# Altium project ECE453.PrjPcb
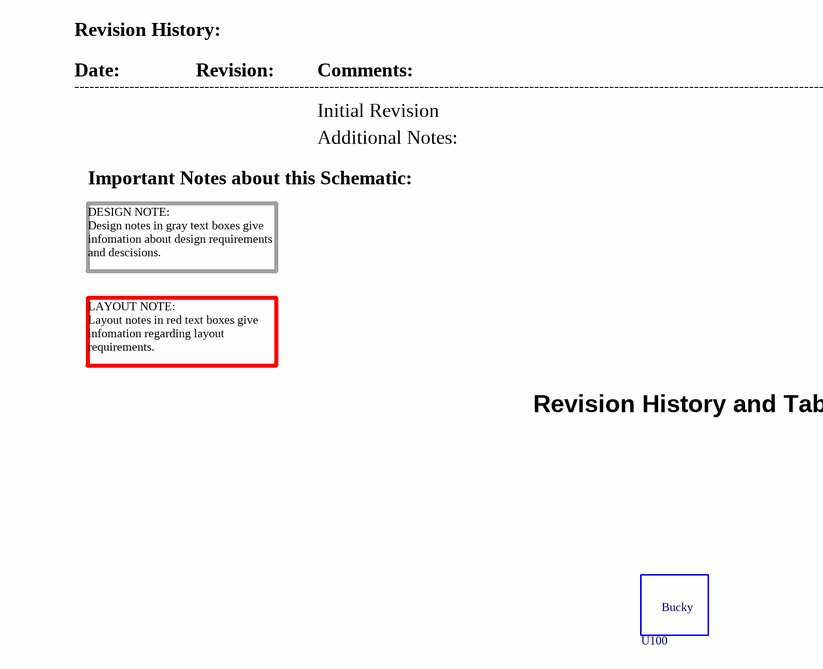
[diagram p0: 01-Revision_History_and_Contents.SchDoc]
4 sheets, 36 parts. Net scope: global (net labels, ports and power ports of the same name join across sheets).
Board file: ECE453.PcbDoc
Sheets:
  01-Revision_History_and_Contents.SchDoc
  02_Connectors.SchDoc
  03-ICs.SchDoc
  04-ICs.SchDoc

## Sheet 01-Revision_History_and_Contents.SchDoc: Revision & History
size A; Revision: A; SheetNumber: 1; SheetTotal: 3; ECE315_Project_Name: ECE453 F24

### Parts
U100  Bucky  [WalkingBucky]  (value not drawn)  (no BOM)

### Notes on the sheet
- Revision History:
- Date:
- ----------------------------------------------------------------------------------------------------------------------------------------------------------------------
- Revision:
- Comments:
- Initial Revision
- Important Notes about this Schematic:
- Additional Notes:
- DESIGN NOTE:
  Design notes in gray text boxes give infomation about design requirements and descisions.
- LAYOUT NOTE:
  Layout notes in red text boxes give infomation regarding layout requirements.
- Revision History and Table of Contents
- Title:
- Size:
- A
- Project
- Rev:
- Sheet:
- of
- College of Engineering
- 1415 Engineering Drive
- Madison, WI 53706

### Library data of the parts
U100 = Bucky: Bucky Badger Image; Manufacturer Part Number: UW Bucky

## Sheet 02_Connectors.SchDoc: Off Board Connectors
size A; Revision: A; SheetNumber: 2; SheetTotal: 3; ECE315_Project_Name: ECE453 F24
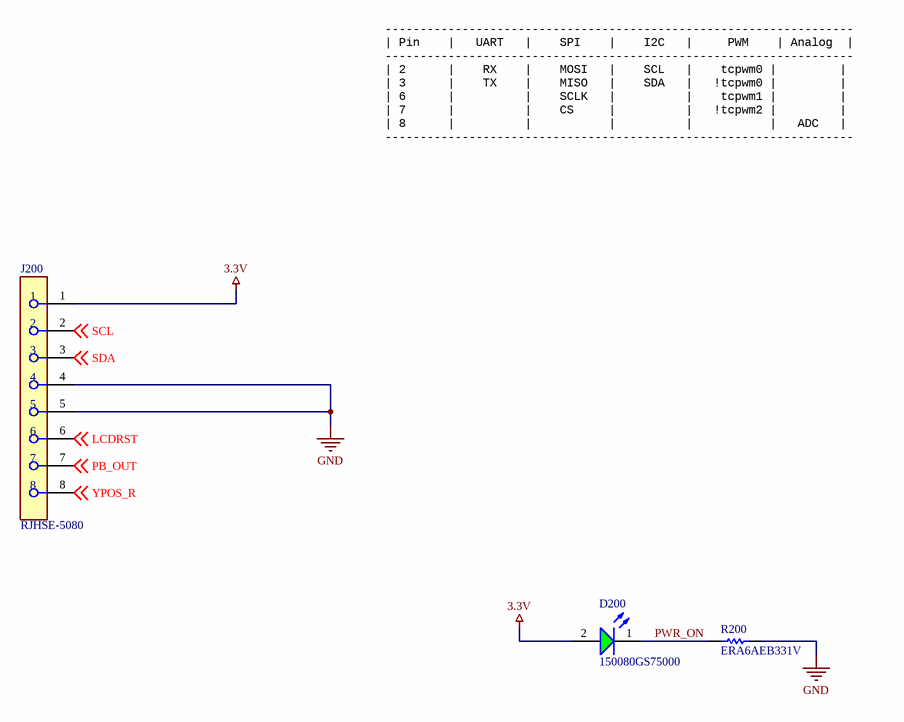
[diagram p1: 02_Connectors.SchDoc]

### Parts
D200  150080GS75000  [WL-SMCW_0805_150080xx75000]
J200  RJHSE-5080  [FP-RJHSE-5080-MFG]
R200  ERA6AEB331V  [RESC2013X60X40LL20T25]

### Nets
3.3V: D200.2(A) J200.1
GND: J200.4 J200.5 R200.2
LCDRST: J200.6 ; off-sheet LCDRST
PB_OUT: J200.7 ; off-sheet PB_OUT
PWR_ON: D200.1(K) R200.1
SCL: J200.2 ; off-sheet SCL
SDA: J200.3 ; off-sheet SDA
YPOS_R: J200.8 ; off-sheet YPOS_R

### Notes on the sheet
- -------------------------------------------------------------------
  | Pin    |   UART   |    SPI    |    I2C   |     PWM    | Analog  |
  -------------------------------------------------------------------
  | 2      |    RX    |    MOSI   |    SCL   |    tcpwm0 |         |
  | 3      |    TX    |    MISO   |    SDA   |   !tcpwm0 |         |
  | 6      |          |    SCLK   |          |    tcpwm1 |         |
  | 7      |          |    CS     |          |   !tcpwm2 |         |
  | 8      |          |           |          |           |   ADC   |
  -------------------------------------------------------------------
- Title:
- Size:
- A
- Project
- Rev:
- Sheet:
- of
- College of Engineering
- 1415 Engineering Drive
- Madison, WI 53706

### Library data of the parts
D200 = CMP-1426-00007-3: WURTH ELEKTRONIK - 150080GS75000 - LED, Green, SMD, 0805, 30 mA, 3.2 V, 520 nm; Forward Voltage: 3.2V; Viewing Angle: 140°; Power Dissipation: 105mW; Peak Wavelength: 515nm; Max Reverse Voltage (DC): 5V; Luminous Intensity: 450mcd; Wavelength: 525nm; Max Junction Temperature (Tj): 95°C; Forward Current: 100mA; Test Current: 20mA; Lens Style: Clear, Rectangular; Length: 2mm; Case/Package: 0805; Case Code (Metric): 2012; Color: Green; Height: 700µm; Width: 1.25mm; Packaging: Tape and Reel; Mount: Surface Mount; REACH SVHC: Unknown; RoHS: Compliant; Min Operating Temperature: -40°C; Reverse Voltage: 5V; Max Operating Temperature: 85°C; Dominant Wavelength: 525nm; Case Code (Imperial): 0805
J200 = CMP-02366-000003-1: CONN MOD JACK 8P8C R/A UNSHLD; Manufacturer: Amphenol; Current Rating: 1.5A; Voltage Rating: 125V; Pitch: 1.02mm; Conn Orientation: Right Angle; Number Of Contacts: 8; Is Female: yes; Conn Gender: Female; Contact Resistance: 20mR; Number of Ports: 1; Connector Type: RJ45; Lead Free: Yes; Device Class L3: unset; Footprint Url: https://cdn.amphenol-icc.com/media/wysiwyg/files/drawing/rjhse5080.pdf?__cf_chl_jschl_tk__=e349db0bbbb6188a39347cd5e541b92fa02c9719-1587748343-0-AW7tChdeHzRPLX9gSWj7WrKaXQoY9BsmT9Ek0h-T62M9y3Rs9iypFcOtkzb-6sGYQEjFE-jcoNciDETCOZrh1rYyOesac5SvYLoLwHIsHvF4AKBlx-MXmfZUVk9OTTJLqyQq2qMm0PFRLJpNcK0nrKResqOniRSYixG2sPTmOPraH-ULJFBDL602CHqcI9KKBgTq90Jh1OL2Td4moJ99rFsJRJ1Tk_uoxGe8ublcP_ARu-uLpWcQrBcwOcHDTAwL29DAwVaqcH7ta8Ks7WMlHmVl_pILeEDwT0bE9vu5Pa5S3PtNRF1leuFkgi_FMbUxTDulc5xzbXSfng8srUIV1lWXny5nx1fZJEUa_w97yKjffzBMxiWLWVN-V7-uqAaPbyv_m-wRyw5O25OZNyJOeGU; ComponentLink2URL: https://cdn.amphenol-icc.com/media/wysiwyg/files/documentation/datasheet/inputoutput/io-modjack-rjhse.pdf; Device Class L1: Connectors; Package: CONN_MOD_JACK; Mouser Description: Modular Connectors / Ethernet Connectors R/A RJ45 NONSHIELDED 8 CONT NO LEDS; Manufacturer Part Number: RJHSE-5080; Octopart: https://octopart.com/rjhse-5080-amphenol-45060; Category: Conn; Height: 0.535inch; Temperature: -55°C to +85°C; Digikey Description: CONN MOD JACK 8P8C R/A UNSHLD; Device Class L2: Modular / Ethernet Connectors; Contact Material: Gold,Nickel; ComponentLink2Description: Datasheet; Temperature Range Low: -55°C; RoHS: TRUE; Automotive: No; Temperature Range High: +85°C; Supplier: Digikey; Supplier Part Number: RJHSE-5080-ND; Stock: 72112; Pricing: 1=1.03, 10=0.867, 25=0.832, 50=0.8142, 100=0.7788, 250=0.708, 500=0.6372, 1000=0.56641, 2500=0.51331 (USD); Mounting Technology: Through Hole,Panel; Contact Plating: Gold; Max Current Rating: 1.5A; Number of Positions Loaded: 8; Max Voltage Rating (AC): 125V; Orientation: Right Angle; Packaging: Rail/Tube; Gender: Female; Termination: Solder; Number of Positions: 8; Voltage Rating (DC): 125V; Length: 15.75mm; Depth: 14.99mm; Radiation Hardening: No; RoHS Compliant: Yes; Reach SVHC Compliant: Unknown; ComponentLink1URL: https://datasheet.ciiva.com/7629/1682821-7629402.pdf?src-supplier=Element14; ComponentLink1Description: https://datasheet.ciiva.com/7629/1682821-7629402.pdf?src-supplier=Element14; ComponentLink3URL: https://datasheet.ciiva.com/1432/1693748-1432448.pdf?src-supplier=Element14; ComponentLink3Description: https://datasheet.ciiva.com/1432/1693748-1432448.pdf?src-supplier=Element14
R200 = CMP-2001-00628-1: Manufacturer: Panasonic; Part Number: ERA6AEB331V

## Sheet 03-ICs.SchDoc: ICs
size A; Revision: A; SheetNumber: 3; SheetTotal: 3; ECE315_Project_Name: ECE453 F24
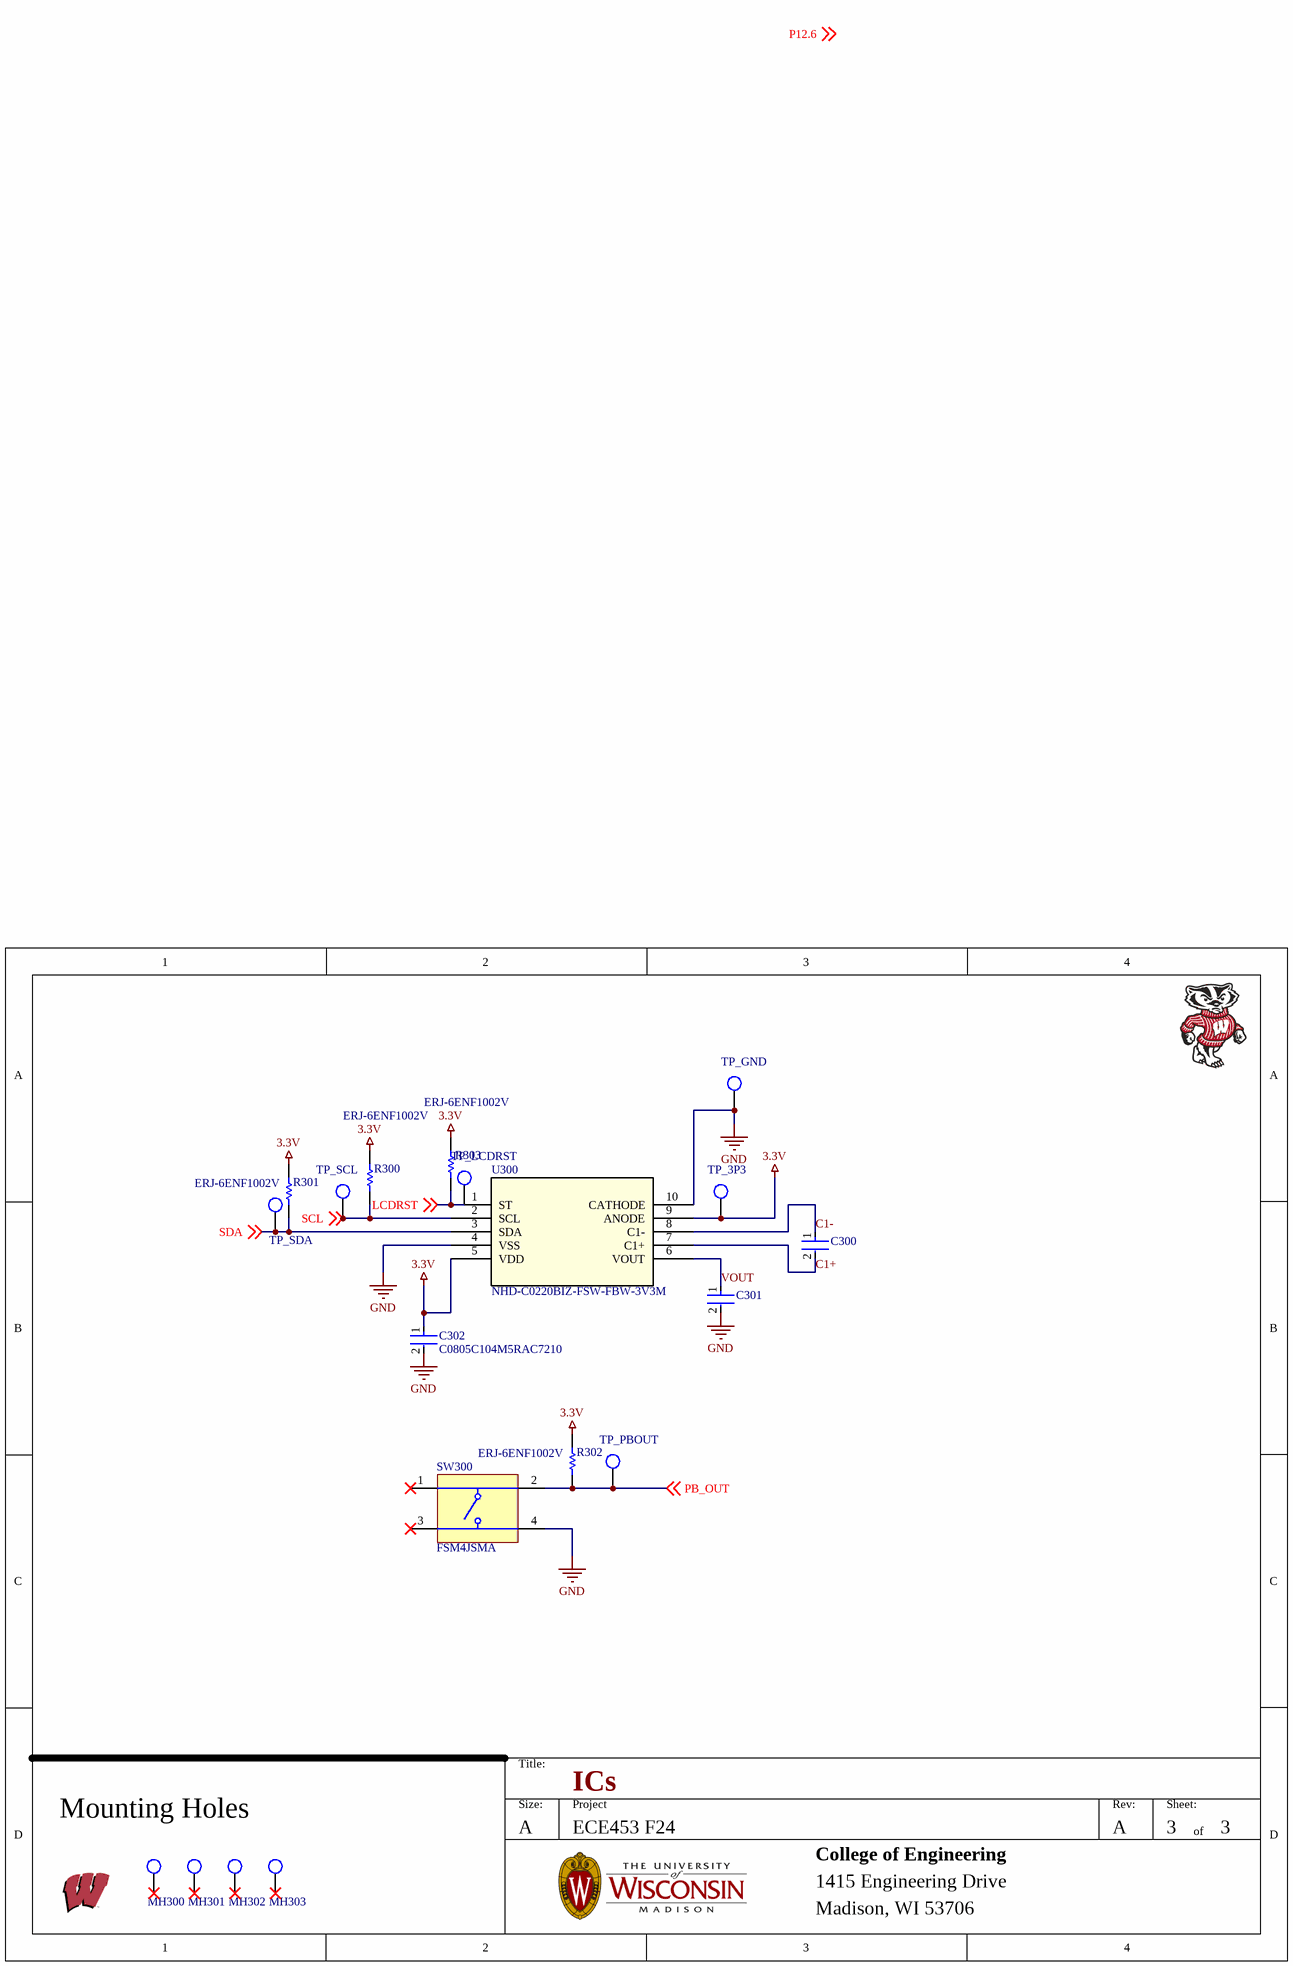
[diagram p2: 03-ICs.SchDoc]

### Parts
C300  C0805C104M5RAC7210  [FP-C0805C-DN-MFG]  (value not drawn)
C301  C0805C104M5RAC7210  [FP-C0805C-DN-MFG]  (value not drawn)
C302  C0805C104M5RAC7210  [FP-C0805C-DN-MFG]
MH300  MHOLE_2_95MM  [MHOLE_2_95MM]  (value not drawn)
MH301  MHOLE_2_95MM  [MHOLE_2_95MM]  (value not drawn)
MH302  MHOLE_2_95MM  [MHOLE_2_95MM]  (value not drawn)
MH303  MHOLE_2_95MM  [MHOLE_2_95MM]  (value not drawn)
R300  ERJ-6ENF1002V  [RESC2013X70X40ML20T20]
R301  ERJ-6ENF1002V  [RESC2013X70X40ML20T20]
R302  ERJ-6ENF1002V  [RESC2013X70X40ML20T20]
R303  ERJ-6ENF1002V  [RESC2013X70X40ML20T20]
SW300  FSM4JSMA  [TECO-FSM4JSMA_V]
TP_3P3  TP_5019  [FP-5019-MFG]  (value not drawn)
TP_GND  TP_5019  [FP-5019-MFG]  (value not drawn)
TP_LCDRST  TP_5019  [FP-5019-MFG]  (value not drawn)
TP_PBOUT  TP_5019  [FP-5019-MFG]  (value not drawn)
TP_SCL  TP_5019  [FP-5019-MFG]  (value not drawn)
TP_SDA  TP_5019  [FP-5019-MFG]  (value not drawn)
U300  NHD-C0220BIZ-FSW-FBW-3V3M  [NHD-C0220BIZ-FSW-FBW-3V3M_NDI]

### Nets
3.3V: C302.1 R300.2 R301.2 R302.2 R303.2 TP_3P3.1 U300.5(VDD) U300.9(ANODE)
GND: C301.2 C302.2 SW300.4 TP_GND.1 U300.4(VSS) U300.10(CATHODE)
C1+: C300.2 U300.7(C1+)
C1-: C300.1 U300.8(C1-)
LCDRST: R303.1 TP_LCDRST.1 U300.1(ST) ; off-sheet LCDRST
PB_OUT: R302.1 SW300.2 TP_PBOUT.1 ; off-sheet PB_OUT
SCL: R300.1 TP_SCL.1 U300.2(SCL) ; off-sheet SCL
SDA: R301.1 TP_SDA.1 U300.3(SDA) ; off-sheet SDA
VOUT: C301.1 U300.6(VOUT)

Not connected (* = marked no-connect by the designer): MH300 1*; MH301 1*; MH302 1*; MH303 1*; SW300 1* 3*

### Notes on the sheet
- Mounting Holes
- Labels drawn without touching a wire or pin: P12.6
- Title:
- Size:
- A
- Project
- Rev:
- Sheet:
- of
- College of Engineering
- 1415 Engineering Drive
- Madison, WI 53706

### Library data of the parts
C300 C301 = CMP-03020-012155-1: 1uF; Manufacturer: KEMET; Tolerance: 0.2; Capacitance: 0.10 μF; Material: Ceramic; Temperature Characteristic: X7R; Voltage Rating: 50 V; Temperature Coefficient: 30ppm/°C; Value: 0.10 μF; Manufacturer Part Number: C0805C104M5RAC7210; Octopart: https://octopart.com/c0805c104m5rac7210-kemet-3909515; Ipc Land Pattern Name: CAPC200125X78; Automotive: No; Device Class L1: Passive Components; Height: 0.88mm; Category: Cap; Temperature Range Low: -55°C; Package: C0805C-DN; Device Class L3: Ceramic Capacitors; Temperature: -55°C to +125°C; RoHS: TRUE; Temperature Range High: +125°C; ComponentLink2Description: Datasheet; Lead Free: Yes; ComponentLink2URL: https://content.kemet.com/datasheets/KEM_C1003_C0G_SMD.pdf; Device Class L2: Capacitors
C302 = CMP-03020-012155-1: C0805 0.10 μF X7R 30ppm/°C 20.00% 50 V; Manufacturer: KEMET; Tolerance: 0.2; Capacitance: 0.10 μF; Material: Ceramic; Voltage Rating: 50 V; Value: 0.10 μF; Manufacturer Part Number: C0805C104M5RAC7210; Octopart: https://octopart.com/c0805c104m5rac7210-kemet-3909515; Ipc Land Pattern Name: CAPC200125X78; Automotive: No; Device Class L1: Passive Components; Height: 0.88mm; Category: Cap; Temperature Range Low: -55°C; Temperature Characteristic: X7R; Package: C0805C-DN; Device Class L3: Ceramic Capacitors; Temperature: -55°C to +125°C; Temperature Coefficient: 30ppm/°C; RoHS: TRUE; Temperature Range High: +125°C; ComponentLink2Description: Datasheet; Lead Free: Yes; ComponentLink2URL: https://content.kemet.com/datasheets/KEM_C1003_C0G_SMD.pdf; Device Class L2: Capacitors
MH300-MH303 = MHOLE_2_95MM: Mounting Holde; Manufacturer Part Number: UW MTHOLE
R300-R303 = CMP-2001-04376-1: Manufacturer: Panasonic; Part Number: ERJ-6ENF1002V
SW300 = CMP-2000-05602-2: Swicth, SPST, 24 V, -35 to 85 degC, 4-Pin SMD, RoHS, Tape and Reel; Manufacturer: TE Connectivity; Switch Travel: 0.25mm; Mechanical Life: 100000Cycles; Contact Current Rating: 50mA; Operating Force: 1.57N; Actuator Material: Polyamide; Contact Resistance: 100mOhm; Voltage Rating: 24V; Illumination Type: Illuminated; Actuator Length: 0.055inch; Max Voltage Rating (DC): 12V; Case\/Package: SMD/SMT; Orientation: Straight; Datasheet URL: http://www.te.com/commerce/DocumentDelivery/DDEController?Action=showdoc&DocId=Customer+Drawing%7F2-1437565-7%7FV%7Fpdf%7FEnglish%7FENG_CD_2-1437565-7_V.pdf%7F4-1437565-2; Min Operating Temperature: -35degC; Packaging: LoosePiece; Termination: GullWing; Throw Configuration: SPST; Package Description: 4-Pin Surface Mount Device, Body 6 x 6 mm, Pitch 4.5 mm; Mounting Technology: SurfaceMount; Contact Plating: Silver; Datasheet Version: Rev. V, 02/2015; RoHSCompliant: true; Max Operating Temperature: 85degC; Length: 6mm; Voltage Rating (DC): 24V; Electrical Life: 100000Cycles; Current Rating: 50mA; Package Quantity: 750; Mount: SurfaceMount; Package Reference: FSM4JSMA; Manufacturer URL: http://www.te.com/; Width: 6mm; REACH SVHC: Unknown; Contact Material: CopperAlloy
TP_3P3 TP_GND TP_LCDRST TP_PBOUT TP_SCL TP_SDA = TP_5019: Test Point, Mini, SMT, Phos Bronze/Silver, 1000pc Tape & Reel | Keystone Electronics 5019; Manufacturer Part Number: 5019; Plating: Silver; Body Material: Bronze; Number of Contacts: 1NUMBER; Supplier 1: Digikey; Supplier Part Number 1: 36-5019CT-ND; Manufacturer: Keystone Electronics; RoHS: Yes; Category: Terminals; Stock: 282853; Pricing: 1=0.37, 25=0.2496, 100=0.2117, 250=0.1902, 500=0.1756, 1000=0.16229, 2000=0.15019, 3000=0.14362, 5000=0.13585, 7000=0.13102, 10000=0.12613, 25000=0.1211 (USD); Mounting Technology: Surface Mount,PCB; Pins: 1; Contact Plating: Silver; Contact Material: Bronze; Material: Bronze; Packaging: Tape and Reel; Package Quantity: 1; Termination: SMD/SMT; Series: 5019; Height: 0.09inch; Reach SVHC Compliant: No; RoHS Compliant: Yes; Lead Free: Lead Free; ComponentLink1URL: https://datasheet.ciiva.com/14848/m60-2p61-14848437.pdf?src-supplier=Digikey; ComponentLink1Description: https://datasheet.ciiva.com/14848/m60-2p61-14848437.pdf?src-supplier=Digikey; ComponentLink2URL: https://datasheet.ciiva.com/14848/m60-2p61-14848438.pdf?src-supplier=Digikey; ComponentLink2Description: https://datasheet.ciiva.com/14848/m60-2p61-14848438.pdf?src-supplier=Digikey; ComponentLink3URL: https://datasheet.ciiva.com/14848/m60-2p61-14848439.pdf?src-supplier=Digikey; ComponentLink3Description: https://datasheet.ciiva.com/14848/m60-2p61-14848439.pdf?src-supplier=Digikey; ComponentLink4URL: https://datasheet.ciiva.com/16885/70182998-16885945.pdf?src-supplier=Allied+Electronics; ComponentLink4Description: https://datasheet.ciiva.com/16885/70182998-16885945.pdf?src-supplier=Allied+Electronics; ComponentLink5URL: https://datasheet.ciiva.com/16318/m60-2p61-16318395.pdf?src-supplier=Future+Electronics; ComponentLink5Description: https://datasheet.ciiva.com/16318/m60-2p61-16318395.pdf?src-supplier=Future+Electronics
U300 = NHD-C0220BIZ-FSW-FBW-3V3M: LCD COG CHAR 2X20 WH TRANSFL; Mfr_Name: Newhaven Display International; Manufacturer: Newhaven Display; Backlight Type: LED; Interface: I2C; Operating Supply Voltage: 3.3V; Contrast Ratio: 6:1; Number of Characters: 40; Background Color: White; Fluid Type: FSTN POSITIVE; RefDes: RefDes; Type: Type; Supplier: Digikey; Supplier Part Number: NHD-C0220BIZ-FSW-FBW-3V3M-ND; Manufacturer Part Number: NHD-C0220BIZ-FSW-FBW-3V3M; RoHS: Yes; Stock: 13689; Pricing: 1=11.41, 5=10.726, 10=10.041, 50=9.4704, 100=9.2394 (USD); Mounting Technology: Through Hole; Pins: 8; Min Operating Temperature: -20°C; Max Operating Temperature: 70°C; Packaging: Bulk; Series: -; RoHS Compliant: Yes; ComponentLink1URL: https://datasheet.ciiva.com/2102/nhd-c0220biz-fsw-fbw-3v3m-2102241.pdf?src-supplier=Digikey; ComponentLink1Description: https://datasheet.ciiva.com/2102/nhd-c0220biz-fsw-fbw-3v3m-2102241.pdf?src-supplier=Digikey; ComponentLink2URL: https://datasheet.ciiva.com/5326/nhd-c0220biz-fsw-fbw-3v3m-31762-5326184.pdf?src-supplier=Mouser; ComponentLink2Description: https://datasheet.ciiva.com/5326/nhd-c0220biz-fsw-fbw-3v3m-31762-5326184.pdf?src-supplier=Mouser; ComponentLink3URL: https://datasheet.ciiva.com/30148/nhd-c0220biz-fsw-fbw-3v3m-30148736.pdf?src-supplier=Onlinecomponents.com; ComponentLink3Description: https://datasheet.ciiva.com/30148/nhd-c0220biz-fsw-fbw-3v3m-30148736.pdf?src-supplier=Onlinecomponents.com; ComponentLink4URL: https://datasheet.ciiva.com/19478/2189011-19478701.pdf?src-supplier=Jameco; ComponentLink4Description: https://datasheet.ciiva.com/19478/2189011-19478701.pdf?src-supplier=Jameco

## Sheet 04-ICs.SchDoc: ICs
size A; Revision: A; SheetNumber: 3; SheetTotal: 3; ECE315_Project_Name: ECE453 F24
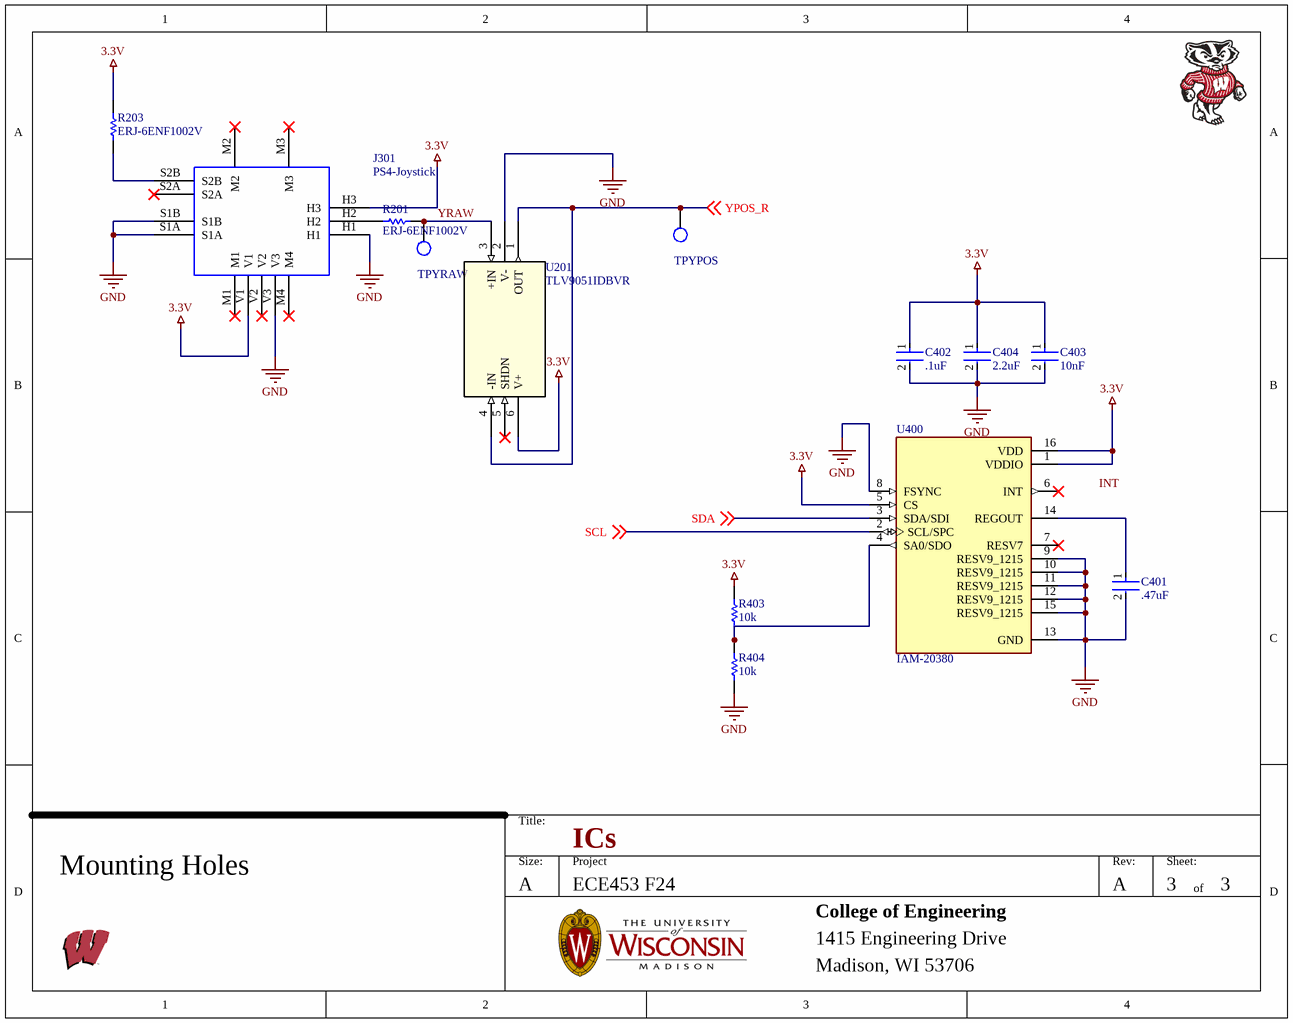
[diagram p3: 04-ICs.SchDoc]

### Parts
C401  .47uF  [FP-C0805C-DN-MFG]
C402  .1uF  [FP-C0805C-DN-MFG]
C403  10nF  [FP-C0805C-DN-MFG]
C404  2.2uF  [FP-C0805C-DN-MFG]
J301  PS4-Joystick  [PS4-Joystick]
R201  ERJ-6ENF1002V  [RESC2013X70X40ML20T20]
R203  ERJ-6ENF1002V  [RESC2013X70X40ML20T20]
R403  10k  [RESC2013X70X40ML20T20]
R404  10k  [RESC2013X70X40ML20T20]
TPYPOS  YRAW  [FP-5019-MFG]  (value not drawn)
TPYRAW  YRAW  [FP-5019-MFG]  (value not drawn)
U201  TLV9051IDBVR  [SOT23_DBV_TEX]
U400  IAM-20380  [PQFN50P300X300X80-16N]

### Nets
3.3V: C402.1 C403.1 C404.1 J301.H3 J301.V1 R203.2 R403.2 U201.6(V+) U400.1(VDDIO) U400.5(CS) U400.16(VDD)
GND: C401.2 C402.2 C403.2 C404.2 J301.H1 J301.S1A J301.S1B J301.V3 R404.1 U201.2(V-) U400.8(FSYNC) U400.9(RESV9_1215) U400.10(RESV9_1215) U400.11(RESV9_1215) U400.12(RESV9_1215) U400.13(GND) U400.15(RESV9_1215)
SCL: U400.2(SCL/SPC) ; off-sheet SCL
SDA: U400.3(SDA/SDI) ; off-sheet SDA
YPOS_R: TPYPOS.1 U201.1(OUT) U201.4(-IN) ; off-sheet YPOS_R
YRAW: R201.1 TPYRAW.1 U201.3(+IN)
NetC401_1: C401.1 U400.14(REGOUT)
NetJ301_H2: J301.H2 R201.2
NetJ301_S2B: J301.S2B R203.1
NetR403_1: R403.1 R404.2 U400.4(SA0/SDO)

Not connected (* = marked no-connect by the designer): J301 M1* M2* M3* M4* S2A* V2*; U201 5(SHDN)*; U400 6(INT)* 7(RESV7)*

### Notes on the sheet
- Mounting Holes
- Labels drawn without touching a wire or pin: INT
- Title:
- Size:
- A
- Project
- Rev:
- Sheet:
- of
- College of Engineering
- 1415 Engineering Drive
- Madison, WI 53706

### Library data of the parts
C401 C403 C404 = CMP-2007-01081-3: CAP CER SMD 0805 .01UF 100V X7R; Manufacturer Part Number: C0805C103K1RAC7210; Manufacturer: KEMET; Capacitance: 10,000 pF; Material: Ceramic; Value: 10,000 pF; Tolerance: 0.1; Temperature Coefficient: 30ppm/°C; Voltage Rating: 100 V; Octopart: https://octopart.com/c0805c103k1rac7210-kemet-3919887; Digikey Description: CAP CER SMD 0805 .01UF 100V X7R; Temperature: -55°C to +125°C; Mouser Description: Multilayer Ceramic Capacitors MLCC - SMD/SMT 100volts 10000pF X7R 10%; Device Class L2: Capacitors; Device Class L1: Passive Components; Ipc Land Pattern Name: CAPC200125X78; Height: 0.88mm; Device Class L3: Ceramic Capacitors; RoHS: TRUE; Package: C0805C-DN; Temperature Characteristic: X7R; Automotive: No; Lead Free: Yes; Category: Cap; Temperature Range High: +125°C; ComponentLink2Description: Datasheet; Temperature Range Low: -55°C; ComponentLink2URL: https://content.kemet.com/datasheets/KEM_C1003_C0G_SMD.pdf
C402 = CMP-2007-00279-2: CAP CER 0.1UF 50V X7R 0805; Manufacturer Part Number: C0805C104K5RACTU; Manufacturer: KEMET; Value: 0.10 μF; Tolerance: 0.1; Temperature Coefficient: 30ppm/°C; Material: Ceramic; Device Class L2: Capacitors; Temperature Range Low: -55°C; Voltage Rating: 50 V; Digikey Description: CAP CER 0.1UF 50V X7R 0805; Category: Cap; ComponentLink2Description: Datasheet; Octopart: https://octopart.com/c0805c104k5ractu-kemet-143926; RoHS: TRUE; ComponentLink2URL: https://content.kemet.com/datasheets/KEM_C1003_C0G_SMD.pdf; Temperature Characteristic: X7R; Temperature: -55°C to +125°C; Height: 0.88mm; Temperature Range High: +125°C; Device Class L1: Passive Components; Automotive: No; Lead Free: Yes; Ipc Land Pattern Name: CAPC200125X78; Device Class L3: Ceramic Capacitors; Mouser Description: Cap Ceramic 0.1uF 50V X7R 10% SMD 2.0 x 1.2 mm 125 C Paper T/R; Capacitance: 0.10 μF; Package: C0805C-DN
R201 R203 = CMP-2001-04376-1: Manufacturer: Panasonic; Part Number: ERJ-6ENF1002V
R403 R404 = CMP-2001-04376-1: Manufacturer: Panasonic; Part Number: ERJ-6ENF1002V
TPYPOS TPYRAW = TP_5019: as TP_3P3 on sheet 03-ICs; Supplier 1: Digikey; Supplier Part Number 1: 36-5019CT-ND; Manufacturer: Keystone Electronics; RoHS: Yes; Category: Terminals; Stock: 282853; Pricing: 1=0.37, 25=0.2496, 100=0.2117, 250=0.1902, 500=0.1756, 1000=0.16229, 2000=0.15019, 3000=0.14362, 5000=0.13585, 7000=0.13102, 10000=0.12613, 25000=0.1211 (USD); Mounting Technology: Surface Mount,PCB; Pins: 1; Contact Plating: Silver; Contact Material: Bronze; Material: Bronze; Packaging: Tape and Reel; Package Quantity: 1; Termination: SMD/SMT; Series: 5019; Height: 0.09inch; Reach SVHC Compliant: No; RoHS Compliant: Yes; Lead Free: Lead Free; ComponentLink1URL: https://datasheet.ciiva.com/14848/m60-2p61-14848437.pdf?src-supplier=Digikey; ComponentLink1Description: https://datasheet.ciiva.com/14848/m60-2p61-14848437.pdf?src-supplier=Digikey; ComponentLink2URL: https://datasheet.ciiva.com/14848/m60-2p61-14848438.pdf?src-supplier=Digikey; ComponentLink2Description: https://datasheet.ciiva.com/14848/m60-2p61-14848438.pdf?src-supplier=Digikey; ComponentLink3URL: https://datasheet.ciiva.com/14848/m60-2p61-14848439.pdf?src-supplier=Digikey; ComponentLink3Description: https://datasheet.ciiva.com/14848/m60-2p61-14848439.pdf?src-supplier=Digikey; ComponentLink4URL: https://datasheet.ciiva.com/16885/70182998-16885945.pdf?src-supplier=Allied+Electronics; ComponentLink4Description: https://datasheet.ciiva.com/16885/70182998-16885945.pdf?src-supplier=Allied+Electronics; ComponentLink5URL: https://datasheet.ciiva.com/16318/m60-2p61-16318395.pdf?src-supplier=Future+Electronics; ComponentLink5Description: https://datasheet.ciiva.com/16318/m60-2p61-16318395.pdf?src-supplier=Future+Electronics
U201 = TLV9051IDBVR: Single 5-MHz, 15-V/µs high slew-rate, RRIO op amp 5-SOT-23 -40 to 125; Mfr_Name: Texas Instruments; RefDes: RefDes; Type: Type; Supplier: Mouser; Supplier Part Number: 595-TLV9051IDBVR; Manufacturer: Texas Instruments; Manufacturer Part Number: TLV9051IDBVR; RoHS: Yes; Category: Amplifiers - Op Amps, Buffer, Instrumentation; Stock: 3599; Pricing: 1=0.47, 10=0.294, 50=0.294, 100=0.237, 1000=0.216, 10000=0.191 (USD)
U400 = IAM-20380: Gyroscope X _Pitch_, Y _Roll_, Z _Yaw_ Â±250, 500, 1000, 2000 27kHz IÂ²C, SPI 16-LGA _3x3_; MF: TDK InvenSense; Value: *; SnapEDA_Link: https://www.snapeda.com/parts/IAM-20380/TDK%20InvenSense/view-part/2757130/?ref=snap; Package: PQFN-16 TDK-InvenSense; MP: IAM-20380; Price: None; Availability: Unavailable

## Nets that join several sheets
3.3V: 02_Connectors (D200.2 J200.1), 03-ICs (8 pins), 04-ICs (11 pins)
GND: 02_Connectors (J200.4 J200.5 R200.2), 03-ICs (6 pins), 04-ICs (17 pins)
LCDRST: 02_Connectors (J200.6), 03-ICs (R303.1 TP_LCDRST.1 U300.1)
PB_OUT: 02_Connectors (J200.7), 03-ICs (R302.1 SW300.2 TP_PBOUT.1)
SCL: 02_Connectors (J200.2), 03-ICs (R300.1 TP_SCL.1 U300.2), 04-ICs (U400.2)
SDA: 02_Connectors (J200.3), 03-ICs (R301.1 TP_SDA.1 U300.3), 04-ICs (U400.3)
YPOS_R: 02_Connectors (J200.8), 04-ICs (TPYPOS.1 U201.1 U201.4)